# Altium project SLT_STM32_A7670C_4G.PrjPcb (part 2 of 2)

## Sheet 03_A7670C_MODEM.SchDoc
size A3; SheetNumber: 4; SheetTotal: 4
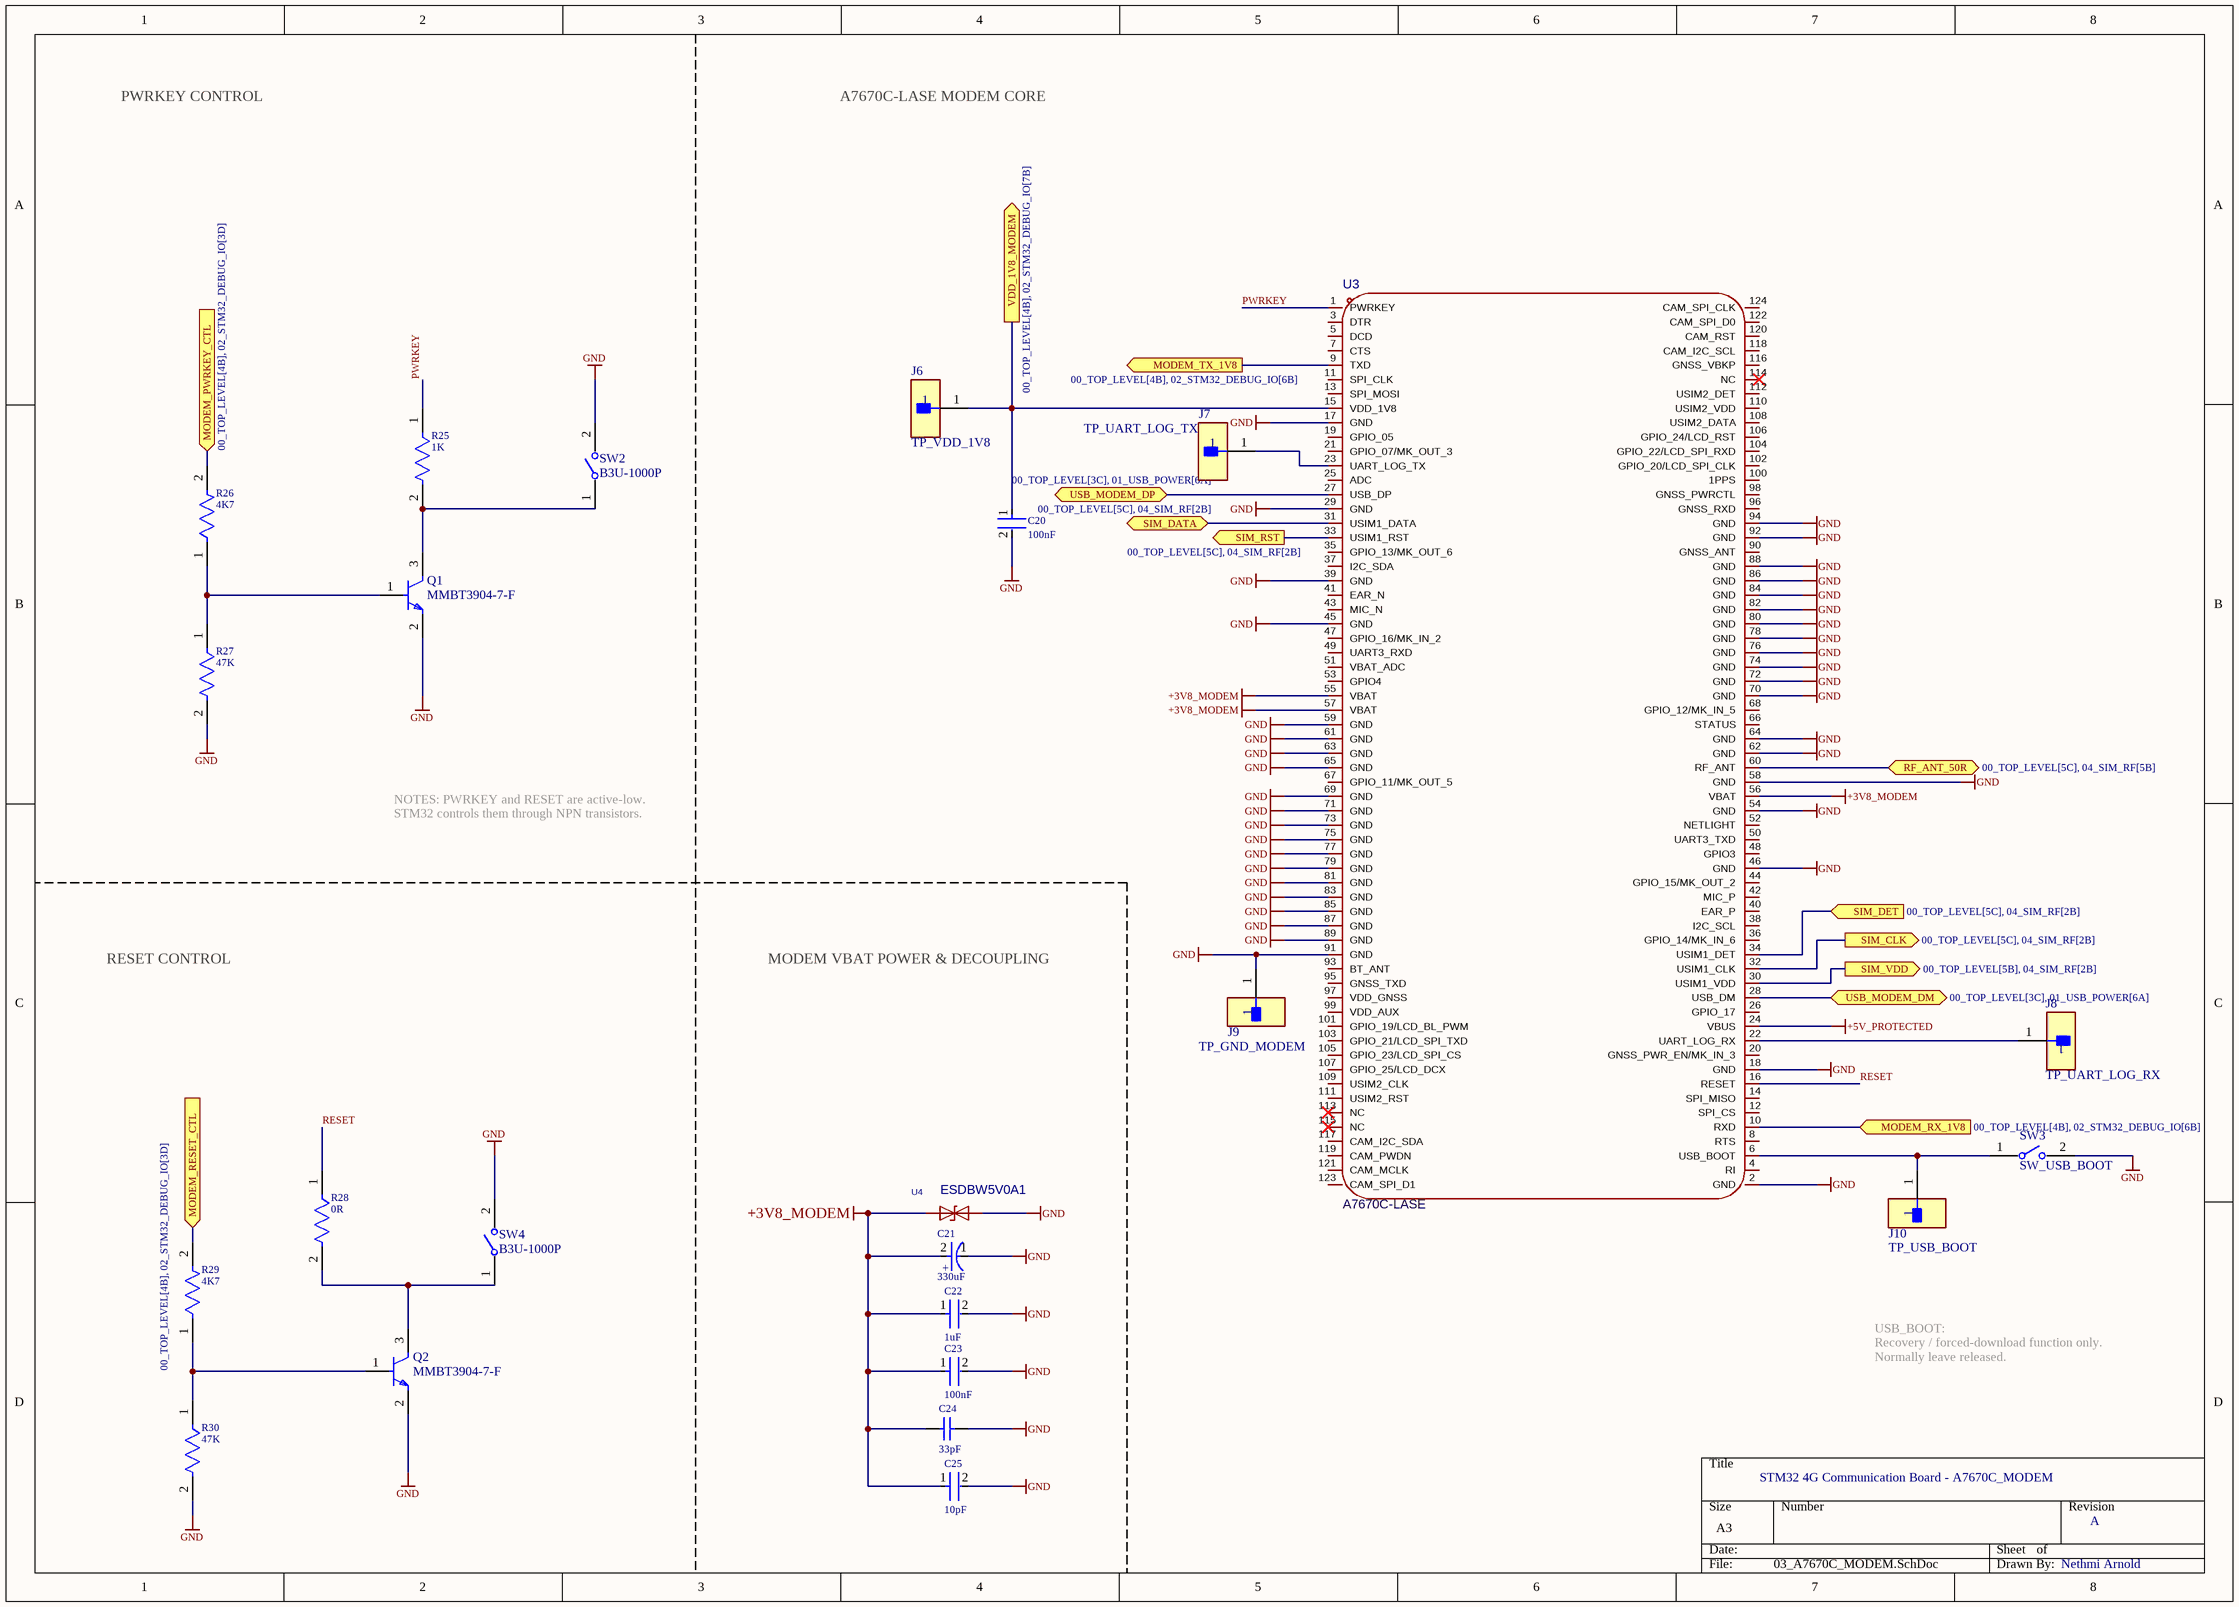
[diagram p3: 03_A7670C_MODEM.SchDoc]

### Parts
C20  100nF  [FP-CC0402-IPC_C]
C21  330uF  [FP-PCG0J331MCL1GS-MFG]
C22  1uF  [FP-CC0603-DA-IPC_B]
C23  100nF  [FP-CC0402-IPC_C]
C24  33pF  [CAPC2013X145X48NL20T23]
C25  10pF  [FP-C0603C-CF-IPC_B]
J6  TP_VDD_1V8  [FP-S2751-46R-MFG]
J7  TP_UART_LOG_TX  [FP-S2751-46R-MFG]
J8  TP_UART_LOG_RX  [FP-S2751-46R-MFG]
J9  TP_GND_MODEM  [FP-S2751-46R-MFG]
J10  TP_USB_BOOT  [FP-S2751-46R-MFG]
Q1  MMBT3904-7-F  [FP-SOT23-IPC_A]
Q2  MMBT3904-7-F  [FP-SOT23-IPC_A]
R25  1K  [FP-CRGCQ0603-IPC_C]
R26  4K7  [FP-AC0603-IPC_C]
R27  47K  [FP-CRGCQ0603-IPC_C]
R28  0R  [FP-CRG0402-IPC_A]
R29  4K7  [FP-AC0603-IPC_C]
R30  47K  [FP-CRGCQ0603-IPC_C]
SW2  B3U-1000P  [FP-B3U-1000P-MFG]
SW3  SW_USB_BOOT  [FP-B3U-1000P-MFG]
SW4  B3U-1000P  [FP-B3U-1000P-MFG]
U3  A7670C-LASE  [LGA-124_L24.0-W24.0-P1.0-A7670C-LASS]
U4  ESDBW5V0A1  [X1-DFN1006-2_L1.0-W0.6-P0.65-BI]

### Ports
MODEM_PWRKEY_CTL (in, see 00_TOP_LEVEL[4B], 02_STM32_DEBUG_IO[3D]), MODEM_RESET_CTL (in, see 00_TOP_LEVEL[4B], 02_STM32_DEBUG_IO[3D]), MODEM_RX_1V8 (in, see 00_TOP_LEVEL[4B], 02_STM32_DEBUG_IO[6B]), MODEM_TX_1V8 (out, see 00_TOP_LEVEL[4B], 02_STM32_DEBUG_IO[6B]), RF_ANT_50R (bidir, see 00_TOP_LEVEL[5C], 04_SIM_RF[5B]), SIM_CLK (out, see 00_TOP_LEVEL[5C], 04_SIM_RF[2B]), SIM_DATA (bidir, see 00_TOP_LEVEL[5C], 04_SIM_RF[2B]), SIM_DET (in, see 00_TOP_LEVEL[5C], 04_SIM_RF[2B]), SIM_RST (out, see 00_TOP_LEVEL[5C], 04_SIM_RF[2B]), SIM_VDD (out, see 00_TOP_LEVEL[5B], 04_SIM_RF[2B]), USB_MODEM_DM (bidir, see 00_TOP_LEVEL[3C], 01_USB_POWER[6A]), USB_MODEM_DP (bidir, see 00_TOP_LEVEL[3C], 01_USB_POWER[6A]), VDD_1V8_MODEM (out, see 00_TOP_LEVEL[4B], 02_STM32_DEBUG_IO[7B])

### Nets
+3V8_MODEM: C21.2(A) C22.1 C23.1 C24.1 C25.1 U3.55(VBAT) U3.56(VBAT) U3.57(VBAT) U4.2(A)
+5V_PROTECTED: U3.24(VBUS)
GND: C20.2 C21.1(C) C22.2 C23.2 C24.2 C25.2 J9.1 Q1.2(E) Q2.2(E) R27.2 R30.2 SW2.2 SW3.2 SW4.2 U3.2(GND) U3.17(GND) U3.18(GND) U3.29(GND) U3.39(GND) U3.45(GND) U3.46(GND) U3.54(GND) U3.58(GND) U3.59(GND) U3.61(GND) U3.62(GND) U3.63(GND) U3.64(GND) U3.65(GND) U3.69(GND) U3.70(GND) U3.71(GND) U3.72(GND) U3.73(GND) U3.74(GND) U3.75(GND) U3.76(GND) U3.77(GND) U3.78(GND) U3.79(GND) U3.80(GND) U3.81(GND) U3.82(GND) U3.83(GND) U3.84(GND) U3.85(GND) U3.86(GND) U3.87(GND) U3.88(GND) U3.89(GND) U3.91(GND) U3.92(GND) U3.94(GND) U4.1(K)
PWRKEY: R25.1 U3.1(PWRKEY)
RESET: R28.1 U3.16(RESET)
SIM_VDD: U3.30(USIM1_VDD) ; port SIM_VDD
NetB4_11: R26.2 ; port MODEM_PWRKEY_CTL
NetB4_12: R29.2 ; port MODEM_RESET_CTL
NetB5_1: U3.9(TXD) ; port MODEM_TX_1V8
NetB5_7: C20.1 J6.1 U3.15(VDD_1V8) ; port VDD_1V8_MODEM
NetB5_8: U3.10(RXD) ; port MODEM_RX_1V8
NetJ7_1: J7.1 U3.23(UART_LOG_TX)
NetJ8_1: J8.1 U3.22(UART_LOG_RX)
NetJ10_1: J10.1 SW3.1 U3.6(USB_BOOT)
NetJ11_CD: U3.34(USIM1_DET) ; port SIM_DET
NetQ1_1: Q1.1(B) R26.1 R27.1
NetQ1_3: Q1.3(C) R25.2 SW2.1
NetQ2_1: Q2.1(B) R29.1 R30.1
NetQ2_3: Q2.3(C) R28.2 SW4.1
NetR3_2: U3.28(USB_DM) ; port USB_MODEM_DM
NetR4_2: U3.27(USB_DP) ; port USB_MODEM_DP
NetR31_1: U3.33(USIM1_RST) ; port SIM_RST
NetR32_1: U3.32(USIM1_CLK) ; port SIM_CLK
NetR33_1: U3.31(USIM1_DATA) ; port SIM_DATA
NetR_RF1_1: U3.60(RF_ANT) ; port RF_ANT_50R

Not connected (* = marked no-connect by the designer): U3 3(DTR) 4(RI) 5(DCD) 7(CTS) 8(RTS) 11(SPI_CLK) 12(SPI_CS) 13(SPI_MOSI) 14(SPI_MISO) 19(GPIO_05) 20(GNSS_PWR_EN/MK_IN_3) 21(GPIO_07/MK_OUT_3) 25(ADC) 26(GPIO_17) 35(GPIO_13/MK_OUT_6) 36(GPIO_14/MK_IN_6) 37(I2C_SDA) 38(I2C_SCL) 40(EAR_P) 41(EAR_N) 42(MIC_P) 43(MIC_N) 44(GPIO_15/MK_OUT_2) 47(GPIO_16/MK_IN_2) 48(GPIO3) 49(UART3_RXD) 50(UART3_TXD) 51(VBAT_ADC) 52(NETLIGHT) 53(GPIO4) 66(STATUS) 67(GPIO_11/MK_OUT_5) 68(GPIO_12/MK_IN_5) 90(GNSS_ANT) 93(BT_ANT) 95(GNSS_TXD) 96(GNSS_RXD) 97(VDD_GNSS) 98(GNSS_PWRCTL) 99(VDD_AUX) 100(1PPS) 101(GPIO_19/LCD_BL_PWM) 102(GPIO_20/LCD_SPI_CLK) 103(GPIO_21/LCD_SPI_TXD) 104(GPIO_22/LCD_SPI_RXD) 105(GPIO_23/LCD_SPI_CS) 106(GPIO_24/LCD_RST) 107(GPIO_25/LCD_DCX) 108(USIM2_DATA) 109(USIM2_CLK) 110(USIM2_VDD) 111(USIM2_RST) 112(USIM2_DET) 113(NC)* 114(NC)* 115(NC)* 116(GNSS_VBKP) 117(CAM_I2C_SDA) 118(CAM_I2C_SCL) 119(CAM_PWDN) 120(CAM_RST) 121(CAM_MCLK) 122(CAM_SPI_D0) 123(CAM_SPI_D1) 124(CAM_SPI_CLK)

### Notes on the sheet
- PWRKEY CONTROL
- A7670C-LASE MODEM CORE
- NOTES: PWRKEY and RESET are active-low.
  STM32 controls them through NPN transistors.
- RESET CONTROL
- MODEM VBAT POWER & DECOUPLING
- USB_BOOT:
  Recovery / forced-download function only.
  Normally leave released.
- STM32 4G Communication Board - A7670C_MODEM
- A
- Nethmi Arnold
- (in symbol CMP-00267-07157897-1) +

### Library data of the parts
C20 C23 = CMP-03422-000905-1: CC0402 100 nF X5R 20.00% 25 V; Manufacturer: YAGEO; Manufacturer Part Number: CC0402MRX5R8BB104; Temperature Coefficient: 30ppm/°C; Voltage Rating: 25 V; Tolerance: 0.2; Material: Ceramic; Automotive Grade: NA; Ipc Land Pattern Name: CAPC10050X50; RoHS: TRUE; Value: 100 nF; Footprint Url: http://www.yageo.com/exep/pages/download/literatures/UPY-C_GEN_24.pdf; ComponentLink2URL: http://www.yageo.com/documents/recent/UPY-GP_NP0_16V-to-50V_16.pdf; Device Class L2: Capacitors; Octopart: https://octopart.com/cc0402mrx5r8bb104-yageo-95634517; Device Class L3: Ceramic Capacitors; Capacitance: 100 nF; Temperature: -55°C to +125°C; Package: CC0402; Automotive: No; Temperature Range Low: -55°C; Temperature Range High: +125°C; Lead Free: Yes; Temperature Characteristic: X5R; Category: Cap; Height: 0.55mm; Device Class L1: Passive Components; ComponentLink2Description: Datasheet
C21 = CMP-00267-07157897-1: PCG0J331MCL1GS Cap Aluminum Polymer 330uF 6.3VDC 20% (6.3 X 6mm) SMD 0.023 Ohm 2700mA 2000h 105C Automotive T/R; Voltage: 6.3V; Leakage Current: 416µA; Dissipation Factor: 0.12%; Life (Hours): 2000hours; Ripple Current (AC): 2.7A; ESR (Equivalent Series Resistance): 23mΩ; Capacitance: 330µF; NexarPartId: 7157897; Lifecycle Status: Production; Length: 6mm; Height - Seated (Max): 5.9944mm; Termination: SMD/SMT; Min Operating Temperature: -55°C; Lead Free: Lead Free; Tolerance: 20%; Height: 6mm; Schedule B: 8532220020; Mount: Surface Mount; Max Operating Temperature: 105°C; Packaging: Tape & Reel; Case/Package: Radial; Voltage Rating: 6.3V; Voltage Rating (DC): 6.3V; Ripple Current: 2.7A; Diameter: 6.3mm; RoHS: Compliant; Radiation Hardening: No
C22 = CMP-03422-000210-1: CAP CER 1UF 6.3V X5R 0603; Manufacturer Part Number: CC0603KRX5R5BB105; Manufacturer: YAGEO; Temperature Coefficient: 15%; Material: Ceramic; Tolerance: 0.1; Temperature: -55°C to +125°C; Footprint Url: http://www.yageo.com/exep/pages/download/literatures/UPY-C_GEN_24.pdf; Value: 1 uF; Lead Free: Yes; Height: 0.9mm; Voltage Rating: 6.3 V; Package: CC0603-DA; Mouser Description: Multilayer Ceramic Capacitors MLCC - SMD/SMT 1uF 6.3V X5R 10%; ComponentLink2URL: http://www.yageo.com/documents/recent/UPY-GPHC_X7R_6.3V-to-50V_18.pdf; Category: Cap; Capacitance: 1 uF; Octopart: https://octopart.com/cc0603krx5r5bb105-yageo-9292796; Voltage: 6.3 V; Automotive: No; Digikey Description: CAP CER 1UF 6.3V X5R 0603; ComponentLink2Description: Datasheet; Device Class L2: Capacitors; Temperature Characteristic: X5R; RoHS: TRUE; Temperature Range High: +125°C; Temperature Range Low: -55°C; Device Class L3: Ceramic Capacitors; Device Class L1: Passive Components
C24 = CMP-2007-01784-1: Part Number: VJ0805A330JXBAC; Manufacturer: Vitramon
C25 = CMP-2006-02999-3: CAP CER 10PF 50V C0G/NP0 0603; Manufacturer Part Number: C0603C100J5GACTU; Manufacturer: KEMET; Temperature Coefficient: 30ppm/°C; Temperature Characteristic: C0G; Material: Ceramic; Automotive Grade: Grade 1; Tolerance: 0.05; Device Class L2: Capacitors; Height: 0.87mm; Capacitance: 10 pF; Value: 10 pF; Package: C0603C-CF; Digikey Description: CAP CER 10PF 50V C0G/NP0 0603; Lead Free: Yes; Voltage Rating: 50 V; Mouser Description: Multilayer Ceramic Capacitors MLCC - SMD/SMT 50volts 10pF C0G 5%; Device Class L1: Passive Components; Octopart: https://octopart.com/c0603c100j5gactu-kemet-138281; Category: Cap; Temperature: -55°C to +125°C; ComponentLink2URL: https://api.kemet.com/component-edge/download/datasheet/C0603C100J5GACAUTO.pdf; Temperature Range High: +125°C; ComponentLink2Description: Datasheet; Automotive: Yes; Device Class L3: Ceramic Capacitors; Temperature Range Low: -55°C; RoHS: TRUE
J6-J10 = CMP-15817-000010-1: PC TEST POINT NATURAL; Plating: Tin; Body Material: Brass; Color: Natural; Material: Copper Alloy; Mount: Surface Mount; Packaging: Cut Tape
Q1 Q2 = CMP-2000-04931-2: TRANS NPN 40V 0.2A SMD SOT23-3; Frequency: 300MHz; Power Dissipation: 350mW; Element Configuration: Single; Max Power Dissipation: 300mW; Max Collector Current: 200mA; Collector Emitter Saturation Voltage: 300mV; Number of Elements: 1; hFE Min: 100; Collector Base Voltage (VCBO): 60V; Emitter Base Voltage (VEBO): 6V; Contact Plating: Tin; Package Quantity: 3000; Max Frequency: 300MHz; REACH SVHC: No SVHC; Max Operating Temperature: 150°C; Width: 1.4mm; Collector Emitter Voltage (VCEO): 40V; Voltage Rating (DC): 40V; Radiation Hardening: No; Case/Package: SOT-23; Height: 1mm; Collector Emitter Breakdown Voltage: 40V; Length: 3.05mm; Polarity: NPN; Packaging: Tape and Reel; Number of Pins: 3; Min Operating Temperature: -55°C; Gain Bandwidth Product: 300MHz; Mount: Surface Mount; Weight: 0.000282oz; Continuous Collector Current: 200mA; Transition Frequency: 300MHz; Max Breakdown Voltage: 40V; Lead Free: Lead Free
R25 = CMP-03211-008566-1: CRGCQ0603 1KΩ 1% ±100ppm/°C 75V; Manufacturer Part Number: CRGCQ0603F1K0; Manufacturer: TE Connectivity; Tolerance: 0.01; Power Rating: 0.1W; Device Class L3: Chip SMD Resistors; Height: 0.55mm; Lead Free: Yes; Value: 1KΩ; ComponentLink2Description: Datasheet; Category: Res; RoHS: TRUE; Series: CRGCQ; Ipc Land Pattern Name: RESC16080X45; Temperature: -55°C to +155°C; Device Class L2: Resistors; Package: CRGCQ0603; Ambient Temperature Range High: +70°C; Octopart: https://octopart.com/crgcq0603f1k0-te+connectivity-91018050; Temperature Range High: +155°C; ComponentLink2URL: https://www.te.com/commerce/DocumentDelivery/DDEController?Action=showdoc&DocId=Data+Sheet%7F1773204-3%7F1%7Fpdf%7FEnglish%7FENG_DS_1773204-3_1.pdf%7F4-2176339-694; Temperature Coefficient: ±100ppm/°C; Voltage Rating: 75V; Composition: Thick Film; Resistance: 1KΩ; Temperature Range Low: -55°C; Device Class L1: Passive Components
R26 R29 = CMP-03412-006483-2: RES 4.7KΩ 1.00% 0.1W 0603; Tolerance: 1%; Resistance: 4.7kR; Case/Package: 0603; RoHS Compliant: Yes
R27 R30 = CMP-03211-009389-1: CRGCQ 0603 47K 1%; Manufacturer: TE Connectivity; Manufacturer Part Number: CRGCQ0603F47K; Voltage Rating: 75V; Power Rating: 0.1W; Tolerance: 0.01; Temperature Coefficient: ±100ppm/°C; Value: 47KΩ; Series: CRGCQ; Device Class L3: Chip SMD Resistors; ComponentLink2Description: Datasheet; Ipc Land Pattern Name: RESC16080X45; Ambient Temperature Range High: +70°C; Package: CRGCQ0603; Height: 0.55mm; Lead Free: Yes; ComponentLink2URL: https://www.te.com/commerce/DocumentDelivery/DDEController?Action=showdoc&DocId=Data+Sheet%7F1773204-3%7F1%7Fpdf%7FEnglish%7FENG_DS_1773204-3_1.pdf%7F4-2176339-1074; Temperature Range Low: -55°C; Octopart: https://octopart.com/crgcq0603f47k-te+connectivity-91018077; RoHS: TRUE; Temperature: -55°C to +155°C; Temperature Range High: +155°C; Digikey Description: CRGCQ 0603 47K 1%; Device Class L1: Passive Components; Composition: Thick Film; Mouser Description: Res Thick Film 0603 47K Ohm 1% 0.1W(1/10W) ±100ppm/C Pad SMD Automotive T/R; Resistance: 47KΩ; Device Class L2: Resistors; Category: Res
R28 = CMP-03211-011400-1: RES SMD 0 OHM JUMPER 1/16W 0402; Number of Resistors: 1; Tolerance: 0%; Voltage Rating: 50V; Insulation Resistance: 1GR; Power Rating: 63mW; Temperature Coefficient: 200ppm/°C; Resistance: 0mR; Weight: 2.3E-05oz; Number of Terminations: 2; Technology: THICK FILM; Resistor Type: Thick Film; Mount: Surface Mount; Termination: Solder; Number of Pins: 2; RoHS Compliant: Yes; Packaging: Tape and Reel; Depth: 0.5mm; Case Code (Metric): 1005; Min Operating Temperature: -55°C; Series: CRG; Height: 0.35mm; Voltage Rating (DC): 50V; Case Code (Imperial): 0402; Max Operating Temperature: 125°C; ELV: Compliant; Case/Package: 0402; Length: 1mm; Radiation Hardening: No; Width: 0.5mm; Package Quantity: 10000
SW2-SW4 = CMP-2100-03586-2: SWITCH TACTILE SPST-NO 0.05A 12V; Contact Resistance: 100mR; Operating Force: 1.5N; Max Current Rating: 50mA; Switch Travel: 0.15mm; Actuator Type: Standard; Mechanical Life: 200000Cycles; Ratings: Dust Proof; Illumination Type: Non-Illuminated; Throw Configuration: SPST; Actuator Length: 0.4mm; Switch Function: Off-Mom; Height: 1.2mm; Width: 3mm; Weight: 0.000776oz; Contact Material: Silver; Max Voltage Rating (DC): 12V; Insulation Resistance: 100MR; Lead Free: Lead Free; Current Rating: 50mA; Termination: SMD/SMT; Length: 4mm; Voltage Rating (DC): 12V; Contact Current Rating: 50mA; Orientation: Straight; Depth: 2.5mm; Max Operating Temperature: 70°C; Packaging: Tape and Reel; Min Operating Temperature: -25°C; Package Quantity: 1; Mount: Surface Mount; Electrical Life: 200000Cycles
U3 = a7670c-lase: Communication System:GSM；LTE；EDGE；GPRS Interface:I2C；UART；USB；GPIO；ADC Communication Frequency:- Voltage - Supply:3.4V~4.2V Voltage - Supply:3.4V~4.2V Current Consumption:- Features:DFOTA function Operating Temperature:-40℃~+85℃ Operating Temperature:-40℃; Manufacturer: SIMCOM(芯讯通无线科技); AddInBom: yes; ModelId: 639229647ea0411984ffffd09147ce72; ModelTransform: 944.88,944.88,0,0,0,0,0,0,0; Symbol: A7670C-LASE; Supplier: LCSC; Supplier Part: C2888406; Manufacturer Part: A7670C-LASE; JLCPCB Part Class: Extended Part; LCSC Part Name: SIMCom LTE Cat 1 模块; Supplier Footprint: SMD,24x24mm; Datasheet: https://item.szlcsc.com/datasheet/A7670C-LASE/3108740.html; ConvertToPcb: yes; FootprintName: LGA-124_L24.0-W24.0-P1.0-A7670C-LASS; ModelName: LGA-124_L24.0-W24.0-P1.0-A7670C-LASS; Communication System: GSM；LTE；EDGE；GPRS; Interface: I2C；UART；USB；GPIO；ADC; Communication Frequency: -; Voltage - Supply: 3.4V~4.2V; Current Consumption: -; Features: DFOTA function; Operating Temperature: -40℃~+85℃
U4 = esdbw5v0a1_c5173252: Reverse Stand-Off Voltage (Vrwm):5V Clamping Voltage:12V Peak Pulse Power Dissipation (Ppp):360W@8/20us Voltage - Breakdown:7.2V Reverse Leakage Current (Ir):100nA Number of Channels:1 Operating Temperature:-55℃~+125℃ Operating Temperature:-55℃~+125℃ leve; Manufacturer: Leiditech(雷卯电子); AddInBom: yes; ModelId: ea1bcde2100540c7b34b3a1c7df79444; ModelTransform: 39.37,23.622,0,0,0,0,0,0,0; Reverse Stand-Off Voltage (Vrwm): 5V; Clamping Voltage: 12V; Voltage - Breakdown: 7.2V; Reverse Leakage Current (Ir): 100nA; Number of Channels: 1; level of protection: IEC 61000-4-4；IEC 61000-4-5；IEC 61000-4-2; Junction Capacitance: 60pF; Symbol: ESDBW5V0A1_C5173252; Supplier: LCSC; Supplier Part: C5173252; Manufacturer Part: ESDBW5V0A1; JLCPCB Part Class: Extended Part; LCSC Part Name: ESD 5V截止; Supplier Footprint: DFN1006-2; Datasheet: https://item.szlcsc.com/datasheet/ESDBW5V0A1/5822823.html; ConvertToPcb: yes; FootprintName: X1-DFN1006-2_L1.0-W0.6-P0.65-BI; ModelName: X1-DFN1006-2_L1.0-W0.6-P0.65-BI; Peak Pulse Power Dissipation (Ppp): 360W@8/20us; Operating Temperature: -55℃~+125℃; Type: ESD

## Sheet 04_SIM_RF.SchDoc
size A3; SheetNumber: 4; SheetTotal: 4
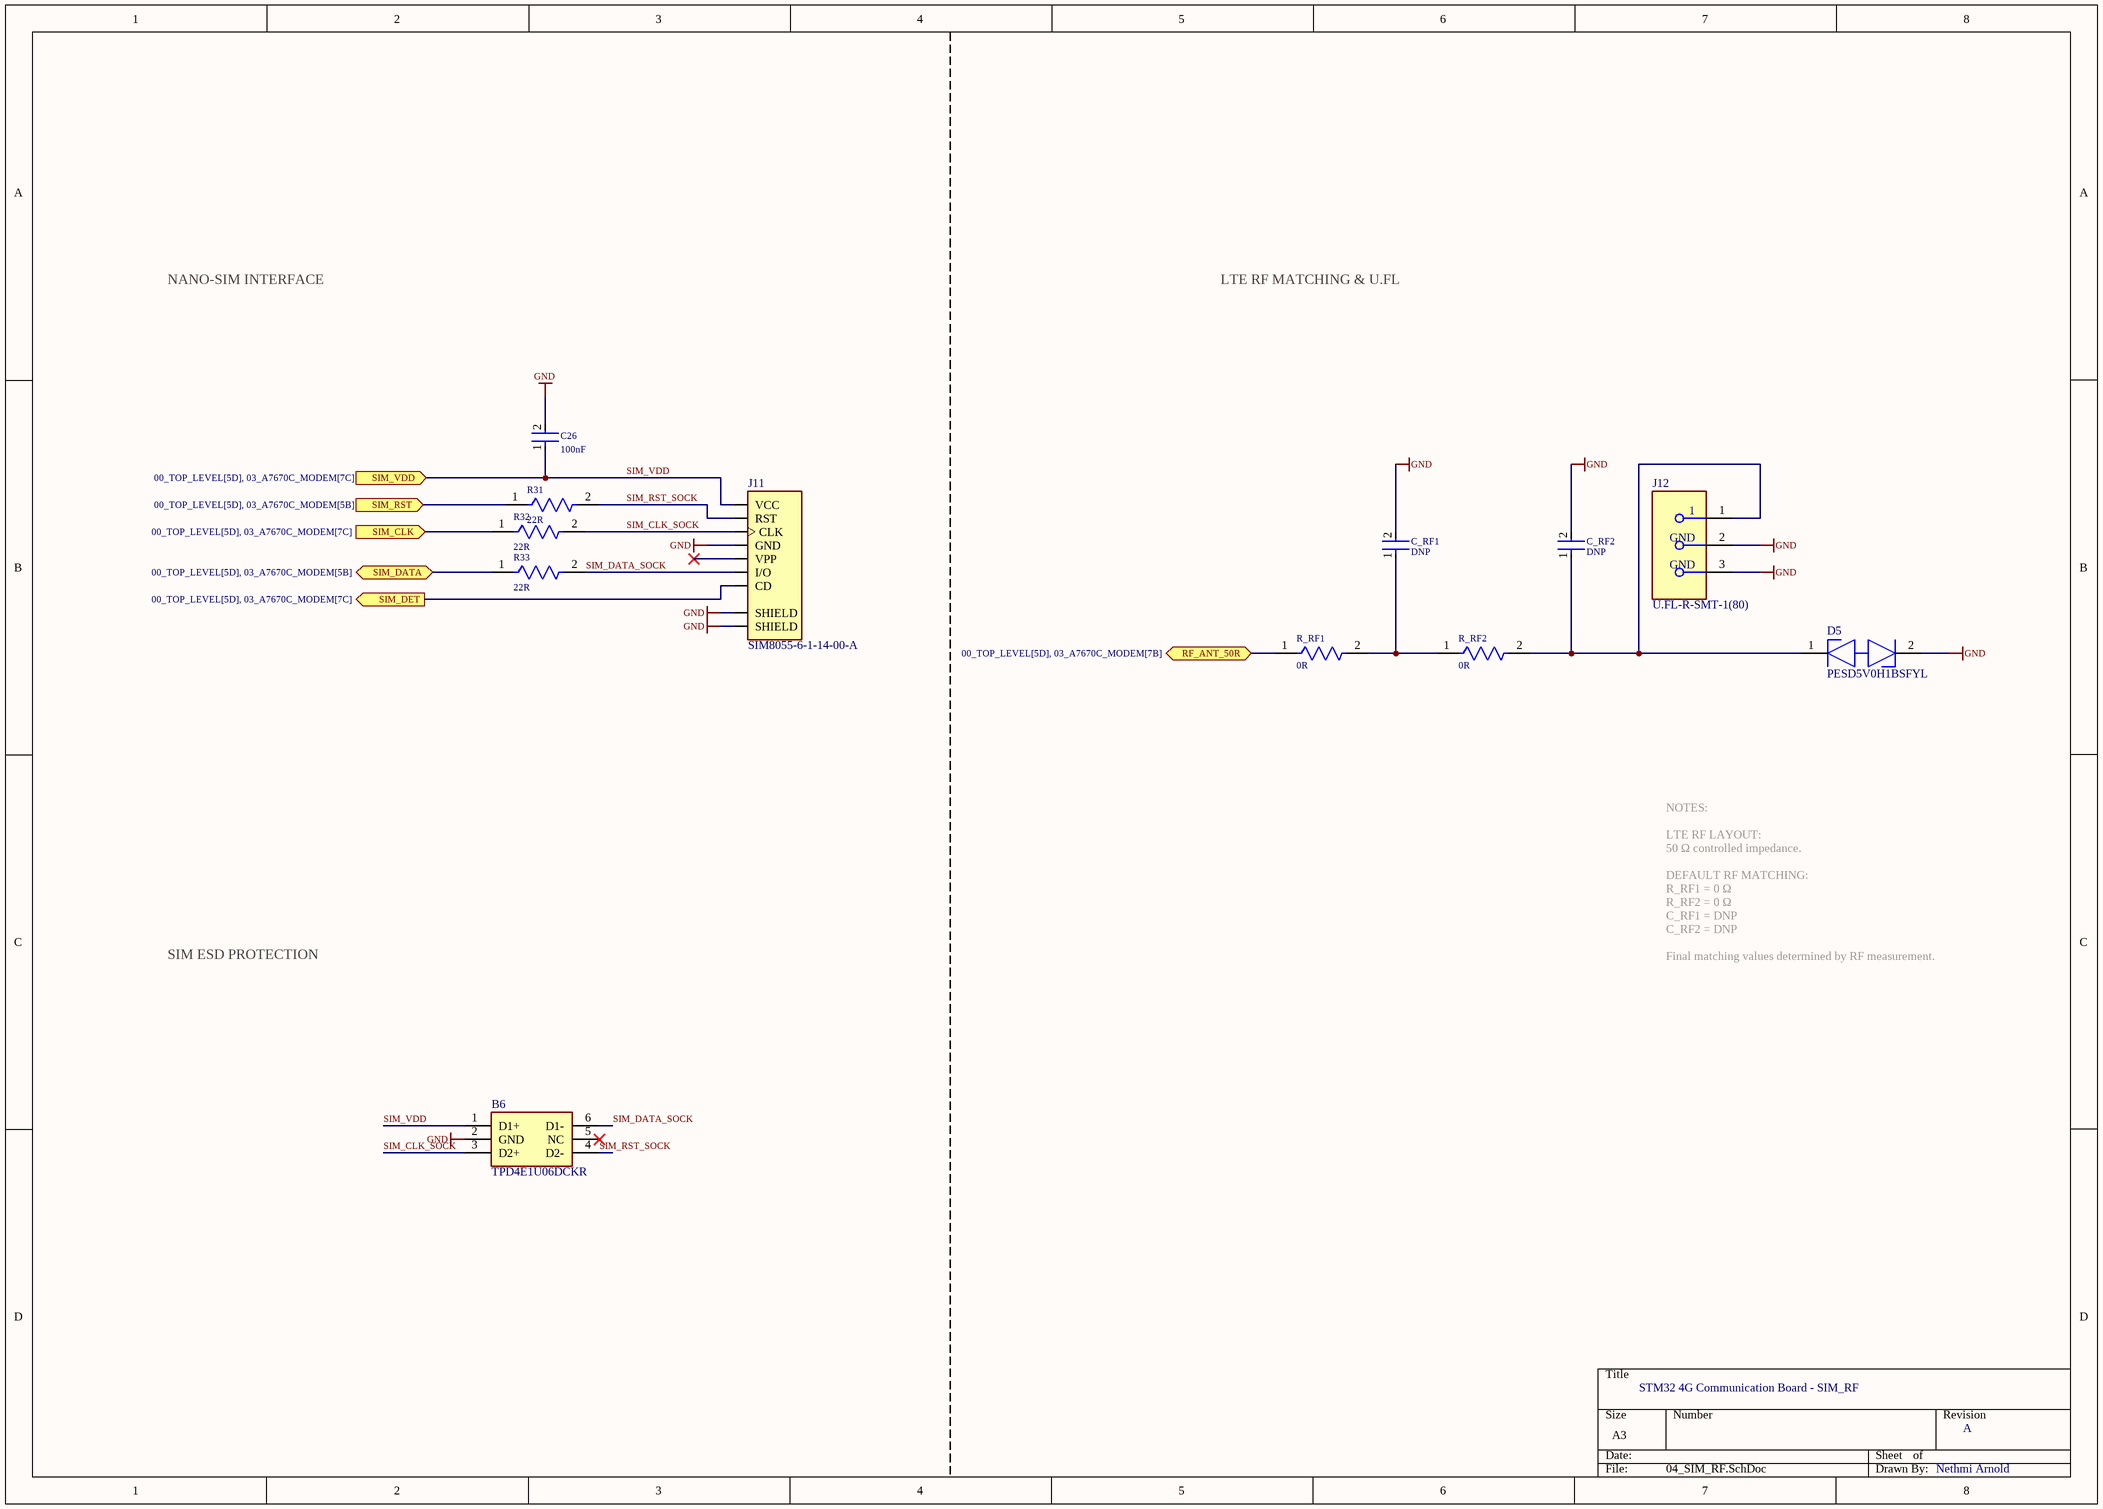
[diagram p4: 04_SIM_RF.SchDoc]

### Parts
B6  TPD4E1U06DCKR  [SOT65P210X110-6N]
C26  100nF  [FP-CC0402-IPC_C]
C_RF1  DNP  [FP-CC0402-IPC_C]
C_RF2  DNP  [FP-CC0402-IPC_C]
D5  PESD5V0H1BSFYL  [FP-SOD962-2-MFG]
J11  SIM8055-6-1-14-00-A  [GCT_SIM8055-6-1-14-00-A]
J12  U.FL-R-SMT-1(80)  [FP-U_FL-R-SMT-1_80-MFG]
R31  22R  [FP-AC0603-IPC_C]
R32  22R  [FP-AC0603-IPC_C]
R33  22R  [FP-AC0603-IPC_C]
R_RF1  0R  [FP-CRG0402-IPC_A]
R_RF2  0R  [FP-CRG0402-IPC_A]

### Ports
RF_ANT_50R (bidir, see 00_TOP_LEVEL[5D], 03_A7670C_MODEM[7B]), SIM_CLK (in, see 00_TOP_LEVEL[5D], 03_A7670C_MODEM[7C]), SIM_DATA (bidir, see 00_TOP_LEVEL[5D], 03_A7670C_MODEM[5B]), SIM_DET (out, see 00_TOP_LEVEL[5D], 03_A7670C_MODEM[7C]), SIM_RST (in, see 00_TOP_LEVEL[5D], 03_A7670C_MODEM[5B]), SIM_VDD (in, see 00_TOP_LEVEL[5D], 03_A7670C_MODEM[7C])

### Nets
GND: B6.2(GND) C26.2 C_RF1.2 C_RF2.2 D5.2(K2) J11.C4(SHIELD) J11.C5(GND) J11.C8(SHIELD) J12.2(GND) J12.3(GND)
SIM_CLK_SOCK: B6.3(D2+) J11.C3(CLK) R32.2
SIM_DATA_SOCK: B6.6(D1-) J11.C7(I/O) R33.2
SIM_RST_SOCK: B6.4(D2-) J11.C2(RST) R31.2
SIM_VDD: B6.1(D1+) C26.1 J11.C1(VCC) ; port SIM_VDD
NetC_RF1_1: C_RF1.1 R_RF1.2 R_RF2.1
NetC_RF2_1: C_RF2.1 D5.1(K1) J12.1 R_RF2.2
NetJ11_CD: J11.CD ; port SIM_DET
NetR31_1: R31.1 ; port SIM_RST
NetR32_1: R32.1 ; port SIM_CLK
NetR33_1: R33.1 ; port SIM_DATA
NetR_RF1_1: R_RF1.1 ; port RF_ANT_50R

Not connected (* = marked no-connect by the designer): B6 5(NC)*; J11 C6(VPP)*

### Notes on the sheet
- NANO-SIM INTERFACE
- LTE RF MATCHING & U.FL
- LTE RF LAYOUT:
  50 Ω controlled impedance.
- NOTES:
- SIM ESD PROTECTION
- DEFAULT RF MATCHING:
  R_RF1 = 0 Ω
  R_RF2 = 0 Ω
  C_RF1 = DNP
  C_RF2 = DNP
  Final matching values determined by RF measurement.
- STM32 4G Communication Board - SIM_RF
- A
- Nethmi Arnold

### Library data of the parts
B6 = TPD4E1U06DCKR: Quad-Channel High-Speed ESD Protection Device; Manufacturer_Name: Texas Instruments; Geometry.Height: 1.1mm; Manufacturer_Part_Number: TPD4E1U06DCKR; Mouser Part Number: 595-TPD4E1U06DCKR; Mouser Price/Stock: https://www.mouser.co.uk/ProductDetail/Texas-Instruments/TPD4E1U06DCKR?qs=FBI%252BX3tnPf27UOVCu86Dnw%3D%3D; Arrow Part Number: TPD4E1U06DCKR; Arrow Price/Stock: https://www.arrow.com/en/products/tpd4e1u06dckr/texas-instruments?utm_currency=USD&region=nac; Datasheet Link: http://www.ti.com/lit/gpn/tpd4e1u06
C26 = CMP-03422-000905-1: as C20 on sheet 03_A7670C_MODEM; Ipc Land Pattern Name: CAPC10050X50; RoHS: TRUE; Value: 100 nF; Footprint Url: http://www.yageo.com/exep/pages/download/literatures/UPY-C_GEN_24.pdf; ComponentLink2URL: http://www.yageo.com/documents/recent/UPY-GP_NP0_16V-to-50V_16.pdf; Device Class L2: Capacitors; Octopart: https://octopart.com/cc0402mrx5r8bb104-yageo-95634517; Device Class L3: Ceramic Capacitors; Capacitance: 100 nF; Temperature: -55°C to +125°C; Package: CC0402; Automotive: No; Temperature Range Low: -55°C; Temperature Range High: +125°C; Lead Free: Yes; Temperature Characteristic: X5R; Category: Cap; Height: 0.55mm; Device Class L1: Passive Components; ComponentLink2Description: Datasheet
C_RF1 C_RF2 = CMP-03422-000670-1: CAP CER 0.033UF 6.3V X5R 0402; Manufacturer Part Number: CC0402KRX5R5BB333; Manufacturer: YAGEO; Value: 33 nF; Temperature Coefficient: 30ppm/°C; Tolerance: 0.1; Automotive Grade: NA; RoHS: TRUE; Voltage Rating: 6.3 V; Digikey Description: CAP CER 0.033UF 6.3V X5R 0402; Footprint Url: http://www.yageo.com/exep/pages/download/literatures/UPY-C_GEN_24.pdf; Package: CC0402; Octopart: https://octopart.com/cc0402krx5r5bb333-yageo-71334363; ComponentLink2URL: http://www.yageo.com/documents/recent/UPY-GP_NP0_16V-to-50V_16.pdf; Device Class L3: Ceramic Capacitors; Temperature: -55°C to +125°C; Capacitance: 33 nF; Height: 0.55mm; Temperature Range High: +125°C; Temperature Range Low: -55°C; Automotive: No; Device Class L1: Passive Components; Lead Free: Yes; Temperature Characteristic: X5R; Device Class L2: Capacitors; Ipc Land Pattern Name: CAPC10050X50; Category: Cap; Material: Ceramic; ComponentLink2Description: Datasheet
D5 = CMP-14436-000004-1: TVS DIODE 5V 5V DSN0603-2; Manufacturer: Nexperia; Breakdown Voltage: 6V; Direction: Bidirectional; Value: 0.15pF; Clamping Voltage: 6.3V; Number Of Channels: 1; Peak Pulse Current: 7A; Max Junction Temp: +150°C; Lead Free: Yes; Reverse Standoff Voltage: 5V; Footprint Url: https://assets.nexperia.com/documents/outline-drawing/SOD962-2.pdf; ComponentLink2Description: Datasheet; Height: 0.32mm; Ambient Temperature Range Low: -40°C; Manufacturer Part Number: PESD5V0H1BSFYL; Octopart: https://octopart.com/pesd5v0h1bsfyl-nexperia-78741149; Ambient Temperature Range High: +125°C; RoHS: TRUE; Temperature: to +150°C; Capacitance: 0.15pF; ComponentLink2URL: https://assets.nexperia.com/documents/data-sheet/PESD5V0H1BSF.pdf; Temperature Range High: +150°C; Device Class L2: TVS Diodes; Digikey Description: TVS DIODE 5V 5V DSN0603-2; Category: Diode; Device Class L3: unset; Device Class L1: Circuit Protection; Package: SOD962-2; Automotive: No
J11 = SIM8055-6-1-14-00-A: 7 (6 + 1) Position Card Connector NANO SIM Surface Mount, Right Angle Gold; MF: Global Connector Technology; SnapEDA_Link: https://www.snapeda.com/parts/SIM8055-6-1-14-00-A/Global+Connector+Technology/view-part/?ref=snap; Package: None; Value: *; MP: SIM8055-6-1-14-00-A; Check_prices: https://www.snapeda.com/parts/SIM8055-6-1-14-00-A/Global+Connector+Technology/view-part/?ref=eda
J12 = CMP-11598-000004-1: CONN U.FL RCPT STR 50 OHM SMD; Mating Cycles: 30; Impedance: 50R; Body Plating: Silver; Center Contact Plating: Gold; Body Material: Bronze; Dielectric Material: Polymer; Connector Type: Receptacle; Number of Ports: 1; Max Frequency: 6GHz; Mount: Surface Mount; Termination: Solder; Case/Package: SMD/SMT; Min Operating Temperature: -40°C; Series: U.FL; Max Operating Temperature: 90°C; Fastening Type: SNAP-ON; RoHS Compliant: Yes; Packaging: Tape and Reel; Package Quantity: 10000; Contact Material: Brass; Housing Color: Beige; Lead Free: Lead Free
R31-R33 = CMP-03412-040387-1: RES 22Ω 5.00% 0.1W 0603; Power Rating: 100mW; Temperature Coefficient: 100ppm/°C; Voltage Rating: 50V; Tolerance: 5%; Series: AC; Resistance: 22R; Width: 0.8mm; Termination: SMD/SMT; Case/Package: 0603; Min Operating Temperature: -55°C; Resistor Type: Thick Film; Number of Terminations: 2; Ratings: AEC-Q200; Features: Moisture Resistant; Length: 1.6mm; Packaging: Tape and Reel; Max Power Dissipation: 100mW; Case Code (Imperial): 0603; Height: 0.45mm; Max Operating Temperature: 155°C; Case Code (Metric): 1608
R_RF1 R_RF2 = CMP-03211-011400-1: as R28 on sheet 03_A7670C_MODEM; Weight: 2.3E-05oz; Number of Terminations: 2; Technology: THICK FILM; Resistor Type: Thick Film; Mount: Surface Mount; Termination: Solder; Number of Pins: 2; RoHS Compliant: Yes; Packaging: Tape and Reel; Depth: 0.5mm; Case Code (Metric): 1005; Min Operating Temperature: -55°C; Series: CRG; Height: 0.35mm; Voltage Rating (DC): 50V; Case Code (Imperial): 0402; Max Operating Temperature: 125°C; ELV: Compliant; Case/Package: 0402; Length: 1mm; Radiation Hardening: No; Width: 0.5mm; Package Quantity: 10000

## Nets that join several sheets
+3V3: 01_USB_POWER (12 pins), 02_STM32_DEBUG_IO (11 pins)
+3V8_MODEM: 01_USB_POWER (FB1.1), 03_A7670C_MODEM (9 pins)
+5V_PROTECTED: 01_USB_POWER (12 pins), 03_A7670C_MODEM (U3.24)
GND: 01_USB_POWER (35 pins), 02_STM32_DEBUG_IO (15 pins), 03_A7670C_MODEM (54 pins), 04_SIM_RF (10 pins)
I2C_SCL: 01_USB_POWER (U2.8), 02_STM32_DEBUG_IO (B4.30 J5.3 R23.1)
I2C_SDA: 01_USB_POWER (U2.7), 02_STM32_DEBUG_IO (B4.31 J5.4 R22.2)
NetB1_1: 01_USB_POWER (B1.1 C6.1 R10.1), 02_STM32_DEBUG_IO (B4.18)
NetB1_6: 01_USB_POWER (B1.6 R12.1), 02_STM32_DEBUG_IO (B4.17)
NetB3_2: 01_USB_POWER (B3.2 R18.2), 02_STM32_DEBUG_IO (B4.32)
NetB3_20: 01_USB_POWER (B3.20 R13.2), 02_STM32_DEBUG_IO (B4.1)
NetB4_11: 02_STM32_DEBUG_IO (B4.11), 03_A7670C_MODEM (R26.2)
NetB4_12: 02_STM32_DEBUG_IO (B4.12), 03_A7670C_MODEM (R29.2)
NetB4_15: 01_USB_POWER (R7.1 U1.9), 02_STM32_DEBUG_IO (B4.15)
NetB4_16: 01_USB_POWER (R8.1 U1.6), 02_STM32_DEBUG_IO (B4.16)
NetB4_22: 01_USB_POWER (R1.2), 02_STM32_DEBUG_IO (B4.22)
NetB4_23: 01_USB_POWER (R2.2), 02_STM32_DEBUG_IO (B4.23)
NetB4_29: 01_USB_POWER (R9.1 U2.6), 02_STM32_DEBUG_IO (B4.29)
NetB5_1: 02_STM32_DEBUG_IO (B5.1), 03_A7670C_MODEM (U3.9)
NetB5_7: 02_STM32_DEBUG_IO (B5.7 C15.1), 03_A7670C_MODEM (C20.1 J6.1 U3.15)
NetB5_8: 02_STM32_DEBUG_IO (B5.8), 03_A7670C_MODEM (U3.10)
NetJ11_CD: 03_A7670C_MODEM (U3.34), 04_SIM_RF (J11.CD)
NetR3_2: 01_USB_POWER (R3.2), 03_A7670C_MODEM (U3.28)
NetR4_2: 01_USB_POWER (R4.2), 03_A7670C_MODEM (U3.27)
NetR31_1: 03_A7670C_MODEM (U3.33), 04_SIM_RF (R31.1)
NetR32_1: 03_A7670C_MODEM (U3.32), 04_SIM_RF (R32.1)
NetR33_1: 03_A7670C_MODEM (U3.31), 04_SIM_RF (R33.1)
NetR_RF1_1: 03_A7670C_MODEM (U3.60), 04_SIM_RF (R_RF1.1)
SIM_VDD: 03_A7670C_MODEM (U3.30), 04_SIM_RF (B6.1 C26.1 J11.C1)